# Altium schematic sheet Beacon Detector.SchDoc
size A; SheetNumber: 3; SheetTotal: 4
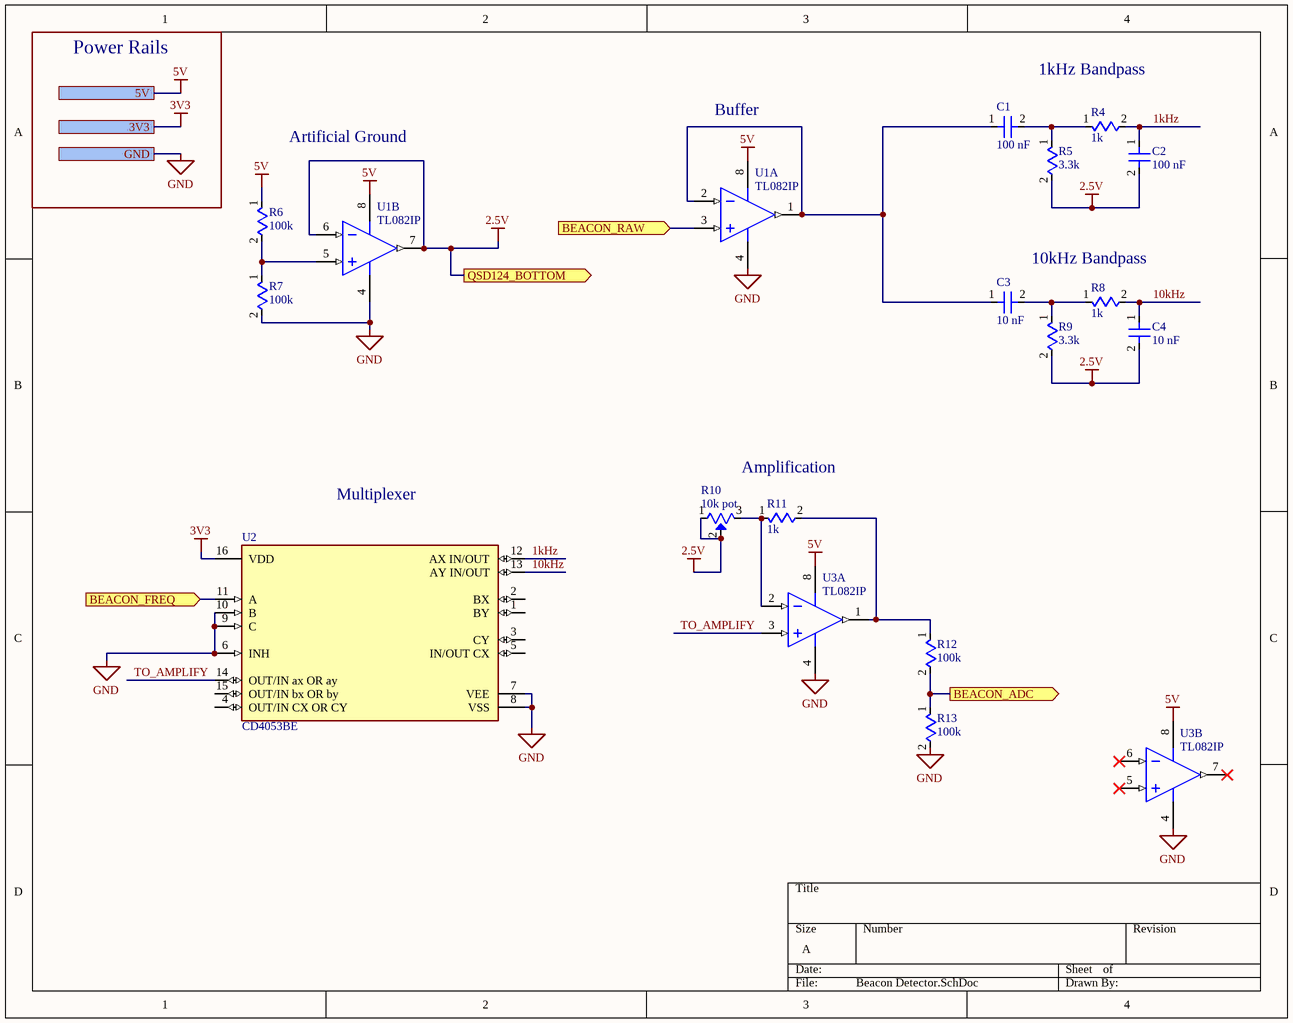
[diagram p0: Beacon Detector.SchDoc]

## Parts
C1  100 nF  [Generic small capacitor]
C2  100 nF  [Generic small capacitor]
C3  10 nF  [Generic small capacitor]
C4  10 nF  [Generic small capacitor]
R4  1k  [Axial 0.5]
R5  3.3k  [Axial 0.5]
R6  100k  [Axial 0.5]
R7  100k  [Axial 0.5]
R8  1k  [Axial 0.5]
R9  3.3k  [Axial 0.5]
R10  10k pot  [RES3_PV36W103C01B00_BRN]
R11  1k  [Axial 0.5]
R12  100k  [Axial 0.5]
R13  100k  [Axial 0.5]
U1  TL082IP  [P0008A]  (parts A,B of 2)
U2  CD4053BE  [FP-N0016A-MFG]
U3  TL082IP  [P0008A]  (parts A,B of 2)

## Ports
3V3 (see RSM[3B], Oscillator[1A]), 5V (see RSM[3B]), BEACON_ADC (out, see RSM[3B]), BEACON_FREQ (in, see RSM[3B]), BEACON_RAW (in, see RSM[4B]), GND (see RSM[3B], Oscillator[1A], Tape Array[1A]), QSD124_BOTTOM (out, see RSM[4B])

## Nets
2.5V: C2.2 C4.2 R5.2 R9.2 R10.1 R10.2 U1.6(IN2-) U1.7(OUT2) ; port QSD124_BOTTOM
3V3: U2.16(VDD) ; port 3V3
5V: R6.1 U1.8(VCC+) U3.8(VCC+) ; port 5V
GND: R7.2 R13.2 U1.4(VCC-) U2.6(INH) U2.7(VEE) U2.8(VSS) U2.9(C) U2.10(B) U3.4(VCC-) ; port GND
1kHz: C2.1 R4.2 U2.12(AX_IN/OUT)
10kHz: C4.1 R8.2 U2.13(AY_IN/OUT)
BEACON_ADC: R12.2 R13.1 ; port BEACON_ADC
BEACON_FREQ: U2.11(A) ; port BEACON_FREQ
BEACON_RAW: U1.3(IN1+) ; port BEACON_RAW
TO_AMPLIFY: U2.14(OUT/IN_ax_OR_ay) U3.3(IN1+)
NetC1_1: C1.1 C3.1 U1.1(OUT1) U1.2(IN1-)
NetC1_2: C1.2 R4.1 R5.1
NetC3_2: C3.2 R8.1 R9.1
NetR6_2: R6.2 R7.1 U1.5(IN2+)
NetR10_3: R10.3 R11.1 U3.2(IN1-)
NetR11_2: R11.2 R12.1 U3.1(OUT1)

Not connected (* = marked no-connect by the designer): U2 1(BY) 2(BX) 3(CY) 4(OUT/IN_CX_OR_CY) 5(IN/OUT_CX) 15(OUT/IN_bx_OR_by); U3 5(IN2+)* 6(IN2-)* 7(OUT2)*

## Notes on the sheet
- Power Rails
- 1kHz Bandpass
- Artificial Ground
- Buffer
- 10kHz Bandpass
- Multiplexer
- Amplification

## Library data of the parts
C1-C4 = CAP_GENERIC
R4-R9 R11-R13 = RES_GENERIC
R10 = Trimmer pot
U1 U3 = CMP-0017-01015-2: JFET-Input Operational Amplifier, 7 to 36 V, -40 to 85 degC, 8-pin DIP (P8), Pb-Free (RoHS); Manufacturer: Texas Instruments; Total Supply Voltage(Max)(+5V is 5, +/-5V is 10): 36; Number of Channels: 2; GBW(Typ)(MHz): 3; Vio (25C)(Max)(mV): 6; Offset Drift(Typ)(uV/C): 18; Slew Rate(Typ)(V/us): 13; Total Supply Voltage(Min)(+5V is 5, +/-5V is 10): 7; CMRR(Min)(dB): 75; Iq per channel(Max)(mA): 2.8; IIB(Max)(pA): 200; Sub Family: General Purpose Amplifier, High Supply Voltage Amplifier (>=30V); Rating: Catalog; ComponentLink1Description: Manufacturer URL; Code_JEDEC: MS-001; Eco-Plan: Pb-Free (RoHS); ComponentLink2Description: Datasheet; PackageReference: P0008A; ComponentLink3Description: Package Specification; ComponentLink1URL: http://www.ti.com/; PackageDescription: 8-Pin Plastic In-Line, Body 9.59 x 6.35 mm, Pitch 2.54 mm; Vn at 1kHz(Typ)(nV/rtHz): 18; PackageVersion: 4040082/E, 04/2010; ComponentLink3URL: http://www.ti.com/litv/pdf/mpdi001b; DatasheetVersion: SLOS081G; PartNumber: TL082IP; Mounting Technology: Through Hole; ComponentLink2URL: http://www.ti.com/lit/ds/symlink/tl082.pdf
U2 = CMP-1575-00068-4: IC MUX/DEMUX TRIPLE 2X1 16DIP; Polarity: Non-Inverting; Quiescent Current: 80nA; Logic Function: Mux; Number of Channels: 3; Throw Configuration: SPDT; Turn-Off Delay Time: 450ns; Number of Terminals/Pins: 16; Max Dual Supply Voltage: 9V; On-State Resistance: 240R; Number of Inputs: 6; Min Supply Voltage: 3V; Min Dual Supply Voltage: 2.5V; Propagation Delay: 60ns; Turn-On Delay Time: 720ns; Max Supply Voltage: 20V; Bandwidth: 30MHz; Supply Type: Single; Operating Supply Voltage: 18V; Mount: Through Hole; Weight: 0.03357oz; Contact Plating: Gold; Number of Pins: 16; Width: 7.62mm; Number of Outputs: 3; Number of Circuits: 3; Max Operating Temperature: 125°C; Min Operating Temperature: -55°C; Packaging: Rail/Tube; RoHS Compliant: Yes; Max Input Voltage: 20V; Radiation Hardening: No; Case/Package: PDIP; Operating Supply Current: 80nA; Package Quantity: 25; REACH SVHC: No SVHC; Nominal Supply Current: 80nA; Lead Free: Lead Free